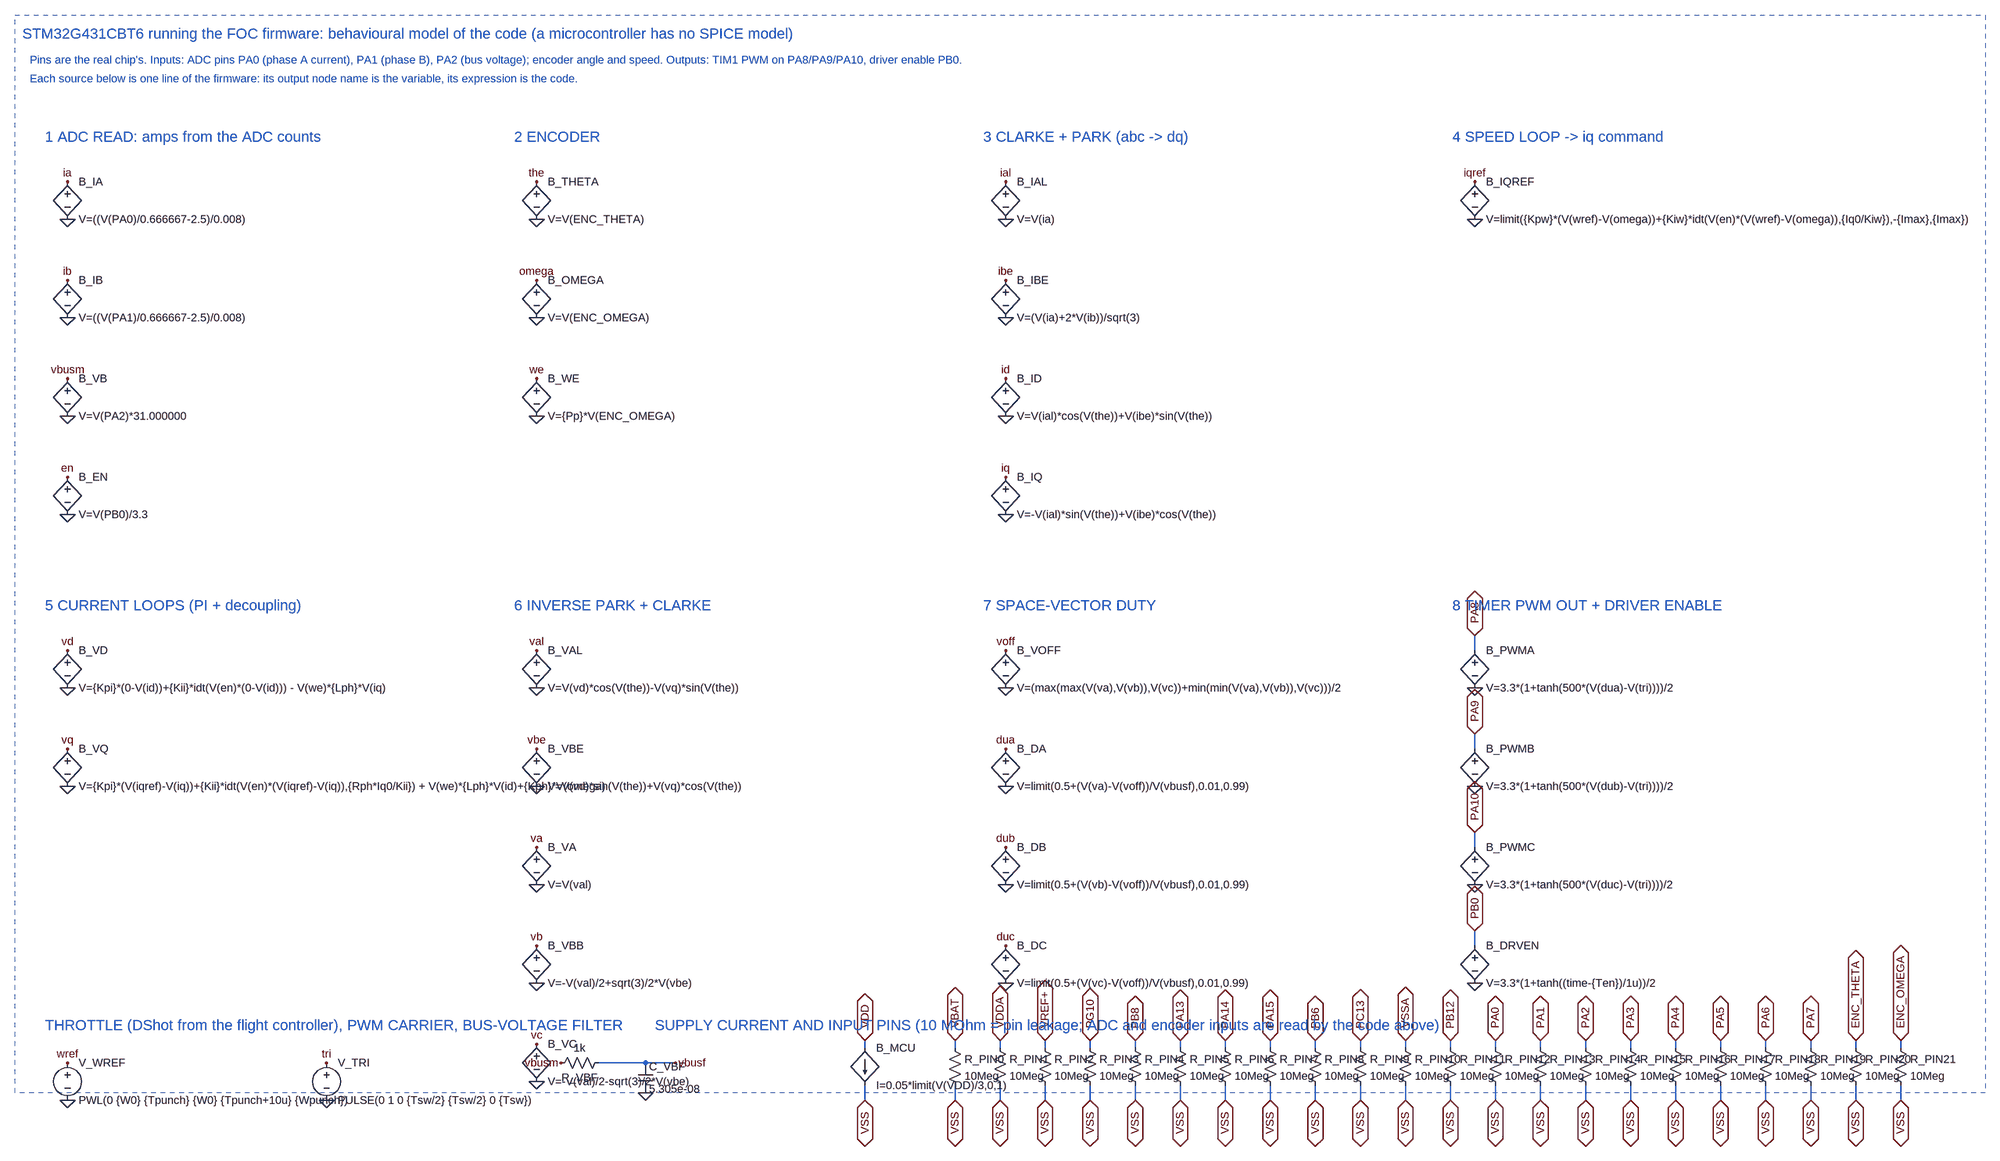
[diagram p0: schematic STM32G431_FOC.asc]
STM32G431_FOC.asc, the LTspice schematic file:
Version 4
SHEET 1 4804 3052
WIRE 1244 2236 1344 2236
WIRE 1344 2236 1408 2236
WIRE 1812 2188 1812 2204
WIRE 1812 2284 1812 2316
WIRE 2004 2188 2004 2204
WIRE 2004 2284 2004 2316
WIRE 2100 2188 2100 2204
WIRE 2100 2284 2100 2316
WIRE 2196 2188 2196 2204
WIRE 2196 2284 2196 2316
WIRE 2292 2188 2292 2204
WIRE 2292 2284 2292 2316
WIRE 2388 2188 2388 2204
WIRE 2388 2284 2388 2316
WIRE 2484 2188 2484 2204
WIRE 2484 2284 2484 2316
WIRE 2580 2188 2580 2204
WIRE 2580 2284 2580 2316
WIRE 2676 2188 2676 2204
WIRE 2676 2284 2676 2316
WIRE 2772 2188 2772 2204
WIRE 2772 2284 2772 2316
WIRE 2868 2188 2868 2204
WIRE 2868 2284 2868 2316
WIRE 2964 2188 2964 2204
WIRE 2964 2284 2964 2316
WIRE 3060 2188 3060 2204
WIRE 3060 2284 3060 2316
WIRE 3112 1324 3112 1356
WIRE 3112 1534 3112 1566
WIRE 3112 1744 3112 1776
WIRE 3112 1954 3112 1986
WIRE 3156 2188 3156 2204
WIRE 3156 2284 3156 2316
WIRE 3252 2188 3252 2204
WIRE 3252 2284 3252 2316
WIRE 3348 2188 3348 2204
WIRE 3348 2284 3348 2316
WIRE 3444 2188 3444 2204
WIRE 3444 2284 3444 2316
WIRE 3540 2188 3540 2204
WIRE 3540 2284 3540 2316
WIRE 3636 2188 3636 2204
WIRE 3636 2284 3636 2316
WIRE 3732 2188 3732 2204
WIRE 3732 2284 3732 2316
WIRE 3828 2188 3828 2204
WIRE 3828 2284 3828 2316
WIRE 3924 2188 3924 2204
WIRE 3924 2284 3924 2316
WIRE 4020 2188 4020 2204
WIRE 4020 2284 4020 2316
FLAG 112 356 ia
FLAG 112 436 0
FLAG 112 566 ib
FLAG 112 646 0
FLAG 112 776 vbusm
FLAG 112 856 0
FLAG 112 986 en
FLAG 112 1066 0
FLAG 1112 356 the
FLAG 1112 436 0
FLAG 1112 566 omega
FLAG 1112 646 0
FLAG 1112 776 we
FLAG 1112 856 0
FLAG 2112 356 ial
FLAG 2112 436 0
FLAG 2112 566 ibe
FLAG 2112 646 0
FLAG 2112 776 id
FLAG 2112 856 0
FLAG 2112 986 iq
FLAG 2112 1066 0
FLAG 3112 356 iqref
FLAG 3112 436 0
FLAG 112 1356 vd
FLAG 112 1436 0
FLAG 112 1566 vq
FLAG 112 1646 0
FLAG 1112 1356 val
FLAG 1112 1436 0
FLAG 1112 1566 vbe
FLAG 1112 1646 0
FLAG 1112 1776 va
FLAG 1112 1856 0
FLAG 1112 1986 vb
FLAG 1112 2066 0
FLAG 1112 2196 vc
FLAG 1112 2276 0
FLAG 2112 1356 voff
FLAG 2112 1436 0
FLAG 2112 1566 dua
FLAG 2112 1646 0
FLAG 2112 1776 dub
FLAG 2112 1856 0
FLAG 2112 1986 duc
FLAG 2112 2066 0
FLAG 3112 1324 PA8
FLAG 3112 1436 0
FLAG 3112 1534 PA9
FLAG 3112 1646 0
FLAG 3112 1744 PA10
FLAG 3112 1856 0
FLAG 3112 1954 PB0
FLAG 3112 2066 0
FLAG 112 2236 wref
FLAG 112 2316 0
FLAG 664 2236 tri
FLAG 664 2316 0
FLAG 1164 2236 vbusm
FLAG 1344 2300 0
FLAG 1408 2236 vbusf
FLAG 1812 2188 VDD
FLAG 1812 2316 VSS
FLAG 2004 2188 VBAT
FLAG 2004 2316 VSS
FLAG 2100 2188 VDDA
FLAG 2100 2316 VSS
FLAG 2196 2188 VREF+
FLAG 2196 2316 VSS
FLAG 2292 2188 PG10
FLAG 2292 2316 VSS
FLAG 2388 2188 PB8
FLAG 2388 2316 VSS
FLAG 2484 2188 PA13
FLAG 2484 2316 VSS
FLAG 2580 2188 PA14
FLAG 2580 2316 VSS
FLAG 2676 2188 PA15
FLAG 2676 2316 VSS
FLAG 2772 2188 PB6
FLAG 2772 2316 VSS
FLAG 2868 2188 PC13
FLAG 2868 2316 VSS
FLAG 2964 2188 VSSA
FLAG 2964 2316 VSS
FLAG 3060 2188 PB12
FLAG 3060 2316 VSS
FLAG 3156 2188 PA0
FLAG 3156 2316 VSS
FLAG 3252 2188 PA1
FLAG 3252 2316 VSS
FLAG 3348 2188 PA2
FLAG 3348 2316 VSS
FLAG 3444 2188 PA3
FLAG 3444 2316 VSS
FLAG 3540 2188 PA4
FLAG 3540 2316 VSS
FLAG 3636 2188 PA5
FLAG 3636 2316 VSS
FLAG 3732 2188 PA6
FLAG 3732 2316 VSS
FLAG 3828 2188 PA7
FLAG 3828 2316 VSS
FLAG 3924 2188 ENC_THETA
FLAG 3924 2316 VSS
FLAG 4020 2188 ENC_OMEGA
FLAG 4020 2316 VSS
IOPIN 3112 1324 BiDir
IOPIN 3112 1534 BiDir
IOPIN 3112 1744 BiDir
IOPIN 3112 1954 BiDir
IOPIN 1812 2188 BiDir
IOPIN 1812 2316 BiDir
IOPIN 2004 2188 BiDir
IOPIN 2004 2316 BiDir
IOPIN 2100 2188 BiDir
IOPIN 2100 2316 BiDir
IOPIN 2196 2188 BiDir
IOPIN 2196 2316 BiDir
IOPIN 2292 2188 BiDir
IOPIN 2292 2316 BiDir
IOPIN 2388 2188 BiDir
IOPIN 2388 2316 BiDir
IOPIN 2484 2188 BiDir
IOPIN 2484 2316 BiDir
IOPIN 2580 2188 BiDir
IOPIN 2580 2316 BiDir
IOPIN 2676 2188 BiDir
IOPIN 2676 2316 BiDir
IOPIN 2772 2188 BiDir
IOPIN 2772 2316 BiDir
IOPIN 2868 2188 BiDir
IOPIN 2868 2316 BiDir
IOPIN 2964 2188 BiDir
IOPIN 2964 2316 BiDir
IOPIN 3060 2188 BiDir
IOPIN 3060 2316 BiDir
IOPIN 3156 2188 BiDir
IOPIN 3156 2316 BiDir
IOPIN 3252 2188 BiDir
IOPIN 3252 2316 BiDir
IOPIN 3348 2188 BiDir
IOPIN 3348 2316 BiDir
IOPIN 3444 2188 BiDir
IOPIN 3444 2316 BiDir
IOPIN 3540 2188 BiDir
IOPIN 3540 2316 BiDir
IOPIN 3636 2188 BiDir
IOPIN 3636 2316 BiDir
IOPIN 3732 2188 BiDir
IOPIN 3732 2316 BiDir
IOPIN 3828 2188 BiDir
IOPIN 3828 2316 BiDir
IOPIN 3924 2188 BiDir
IOPIN 3924 2316 BiDir
IOPIN 4020 2188 BiDir
IOPIN 4020 2316 BiDir
SYMBOL bv 112 340 R0
SYMATTR InstName B_IA
SYMATTR Value V=((V(PA0)/0.666667-2.5)/0.008)
SYMBOL bv 112 550 R0
SYMATTR InstName B_IB
SYMATTR Value V=((V(PA1)/0.666667-2.5)/0.008)
SYMBOL bv 112 760 R0
SYMATTR InstName B_VB
SYMATTR Value V=V(PA2)*31.000000
SYMBOL bv 112 970 R0
SYMATTR InstName B_EN
SYMATTR Value V=V(PB0)/3.3
SYMBOL bv 1112 340 R0
SYMATTR InstName B_THETA
SYMATTR Value V=V(ENC_THETA)
SYMBOL bv 1112 550 R0
SYMATTR InstName B_OMEGA
SYMATTR Value V=V(ENC_OMEGA)
SYMBOL bv 1112 760 R0
SYMATTR InstName B_WE
SYMATTR Value V={Pp}*V(ENC_OMEGA)
SYMBOL bv 2112 340 R0
SYMATTR InstName B_IAL
SYMATTR Value V=V(ia)
SYMBOL bv 2112 550 R0
SYMATTR InstName B_IBE
SYMATTR Value V=(V(ia)+2*V(ib))/sqrt(3)
SYMBOL bv 2112 760 R0
SYMATTR InstName B_ID
SYMATTR Value V=V(ial)*cos(V(the))+V(ibe)*sin(V(the))
SYMBOL bv 2112 970 R0
SYMATTR InstName B_IQ
SYMATTR Value V=-V(ial)*sin(V(the))+V(ibe)*cos(V(the))
SYMBOL bv 3112 340 R0
SYMATTR InstName B_IQREF
SYMATTR Value V=limit({Kpw}*(V(wref)-V(omega))+{Kiw}*idt(V(en)*(V(wref)-V(omega)),{Iq0/Kiw}),-{Imax},{Imax})
SYMBOL bv 112 1340 R0
SYMATTR InstName B_VD
SYMATTR Value V={Kpi}*(0-V(id))+{Kii}*idt(V(en)*(0-V(id))) - V(we)*{Lph}*V(iq)
SYMBOL bv 112 1550 R0
SYMATTR InstName B_VQ
SYMATTR Value V={Kpi}*(V(iqref)-V(iq))+{Kii}*idt(V(en)*(V(iqref)-V(iq)),{Rph*Iq0/Kii}) + V(we)*{Lph}*V(id)+{Kph}*V(omega)
SYMBOL bv 1112 1340 R0
SYMATTR InstName B_VAL
SYMATTR Value V=V(vd)*cos(V(the))-V(vq)*sin(V(the))
SYMBOL bv 1112 1550 R0
SYMATTR InstName B_VBE
SYMATTR Value V=V(vd)*sin(V(the))+V(vq)*cos(V(the))
SYMBOL bv 1112 1760 R0
SYMATTR InstName B_VA
SYMATTR Value V=V(val)
SYMBOL bv 1112 1970 R0
SYMATTR InstName B_VBB
SYMATTR Value V=-V(val)/2+sqrt(3)/2*V(vbe)
SYMBOL bv 1112 2180 R0
SYMATTR InstName B_VC
SYMATTR Value V=-V(val)/2-sqrt(3)/2*V(vbe)
SYMBOL bv 2112 1340 R0
SYMATTR InstName B_VOFF
SYMATTR Value V=(max(max(V(va),V(vb)),V(vc))+min(min(V(va),V(vb)),V(vc)))/2
SYMBOL bv 2112 1550 R0
SYMATTR InstName B_DA
SYMATTR Value V=limit(0.5+(V(va)-V(voff))/V(vbusf),0.01,0.99)
SYMBOL bv 2112 1760 R0
SYMATTR InstName B_DB
SYMATTR Value V=limit(0.5+(V(vb)-V(voff))/V(vbusf),0.01,0.99)
SYMBOL bv 2112 1970 R0
SYMATTR InstName B_DC
SYMATTR Value V=limit(0.5+(V(vc)-V(voff))/V(vbusf),0.01,0.99)
SYMBOL bv 3112 1340 R0
SYMATTR InstName B_PWMA
SYMATTR Value V=3.3*(1+tanh(500*(V(dua)-V(tri))))/2
SYMBOL bv 3112 1550 R0
SYMATTR InstName B_PWMB
SYMATTR Value V=3.3*(1+tanh(500*(V(dub)-V(tri))))/2
SYMBOL bv 3112 1760 R0
SYMATTR InstName B_PWMC
SYMATTR Value V=3.3*(1+tanh(500*(V(duc)-V(tri))))/2
SYMBOL bv 3112 1970 R0
SYMATTR InstName B_DRVEN
SYMATTR Value V=3.3*(1+tanh((time-{Ten})/1u))/2
SYMBOL voltage 112 2220 R0
SYMATTR InstName V_WREF
SYMATTR Value PWL(0 {W0} {Tpunch} {W0} {Tpunch+10u} {Wpunch})
SYMBOL voltage 664 2220 R0
SYMATTR InstName V_TRI
SYMATTR Value PULSE(0 1 0 {Tsw/2} {Tsw/2} 0 {Tsw})
SYMBOL res 1148 2252 R270
WINDOW 0 0 56 VBottom 2
WINDOW 3 32 56 VTop 2
SYMATTR InstName R_VBF
SYMATTR Value 1k
SYMBOL cap 1328 2236 R0
SYMATTR InstName C_VBF
SYMATTR Value 5.305e-08
SYMBOL bi 1812 2204 R0
SYMATTR InstName B_MCU
SYMATTR Value I=0.05*limit(V(VDD)/3,0,1)
SYMBOL res 1988 2188 R0
SYMATTR InstName R_PIN0
SYMATTR Value 10Meg
SYMBOL res 2084 2188 R0
SYMATTR InstName R_PIN1
SYMATTR Value 10Meg
SYMBOL res 2180 2188 R0
SYMATTR InstName R_PIN2
SYMATTR Value 10Meg
SYMBOL res 2276 2188 R0
SYMATTR InstName R_PIN3
SYMATTR Value 10Meg
SYMBOL res 2372 2188 R0
SYMATTR InstName R_PIN4
SYMATTR Value 10Meg
SYMBOL res 2468 2188 R0
SYMATTR InstName R_PIN5
SYMATTR Value 10Meg
SYMBOL res 2564 2188 R0
SYMATTR InstName R_PIN6
SYMATTR Value 10Meg
SYMBOL res 2660 2188 R0
SYMATTR InstName R_PIN7
SYMATTR Value 10Meg
SYMBOL res 2756 2188 R0
SYMATTR InstName R_PIN8
SYMATTR Value 10Meg
SYMBOL res 2852 2188 R0
SYMATTR InstName R_PIN9
SYMATTR Value 10Meg
SYMBOL res 2948 2188 R0
SYMATTR InstName R_PIN10
SYMATTR Value 10Meg
SYMBOL res 3044 2188 R0
SYMATTR InstName R_PIN11
SYMATTR Value 10Meg
SYMBOL res 3140 2188 R0
SYMATTR InstName R_PIN12
SYMATTR Value 10Meg
SYMBOL res 3236 2188 R0
SYMATTR InstName R_PIN13
SYMATTR Value 10Meg
SYMBOL res 3332 2188 R0
SYMATTR InstName R_PIN14
SYMATTR Value 10Meg
SYMBOL res 3428 2188 R0
SYMATTR InstName R_PIN15
SYMATTR Value 10Meg
SYMBOL res 3524 2188 R0
SYMATTR InstName R_PIN16
SYMATTR Value 10Meg
SYMBOL res 3620 2188 R0
SYMATTR InstName R_PIN17
SYMATTR Value 10Meg
SYMBOL res 3716 2188 R0
SYMATTR InstName R_PIN18
SYMATTR Value 10Meg
SYMBOL res 3812 2188 R0
SYMATTR InstName R_PIN19
SYMATTR Value 10Meg
SYMBOL res 3908 2188 R0
SYMATTR InstName R_PIN20
SYMATTR Value 10Meg
SYMBOL res 4004 2188 R0
SYMATTR InstName R_PIN21
SYMATTR Value 10Meg
RECTANGLE Normal 4200 2300 0 0 2
TEXT 16 40 Left 3 ;STM32G431CBT6 running the FOC firmware: behavioural model of the code (a microcontroller has no SPICE model)
TEXT 32 96 Left 2 ;Pins are the real chip's. Inputs: ADC pins PA0 (phase A current), PA1 (phase B), PA2 (bus voltage); encoder angle and speed. Outputs: TIM1 PWM on PA8/PA9/PA10, driver enable PB0.
TEXT 32 136 Left 2 ;Each source below is one line of the firmware: its output node name is the variable, its expression is the code.
TEXT 64 260 Left 3 ;1 ADC READ: amps from the ADC counts
TEXT 1064 260 Left 3 ;2 ENCODER
TEXT 2064 260 Left 3 ;3 CLARKE + PARK (abc -> dq)
TEXT 3064 260 Left 3 ;4 SPEED LOOP -> iq command
TEXT 64 1260 Left 3 ;5 CURRENT LOOPS (PI + decoupling)
TEXT 1064 1260 Left 3 ;6 INVERSE PARK + CLARKE
TEXT 2064 1260 Left 3 ;7 SPACE-VECTOR DUTY
TEXT 3064 1260 Left 3 ;8 TIMER PWM OUT + DRIVER ENABLE
TEXT 64 2156 Left 3 ;THROTTLE (DShot from the flight controller), PWM CARRIER, BUS-VOLTAGE FILTER
TEXT 1364 2156 Left 3 ;SUPPLY CURRENT AND INPUT PINS (10 MOhm = pin leakage; ADC and encoder inputs are read by the code above)

The netlist it stands for:
* STM32G431_FOC.asc
B_IA ia 0 V=((V(PA0)/0.666667-2.5)/0.008)
B_IB ib 0 V=((V(PA1)/0.666667-2.5)/0.008)
B_VB vbusm 0 V=V(PA2)*31.000000
B_EN en 0 V=V(PB0)/3.3
B_THETA the 0 V=V(ENC_THETA)
B_OMEGA omega 0 V=V(ENC_OMEGA)
B_WE we 0 V={Pp}*V(ENC_OMEGA)
B_IAL ial 0 V=V(ia)
B_IBE ibe 0 V=(V(ia)+2*V(ib))/sqrt(3)
B_ID id 0 V=V(ial)*cos(V(the))+V(ibe)*sin(V(the))
B_IQ iq 0 V=-V(ial)*sin(V(the))+V(ibe)*cos(V(the))
B_IQREF iqref 0 V=limit({Kpw}*(V(wref)-V(omega))+{Kiw}*idt(V(en)*(V(wref)-V(omega)),{Iq0/Kiw}),-{Imax},{Imax})
B_VD vd 0 V={Kpi}*(0-V(id))+{Kii}*idt(V(en)*(0-V(id))) - V(we)*{Lph}*V(iq)
B_VQ vq 0 V={Kpi}*(V(iqref)-V(iq))+{Kii}*idt(V(en)*(V(iqref)-V(iq)),{Rph*Iq0/Kii}) + V(we)*{Lph}*V(id)+{Kph}*V(omega)
B_VAL val 0 V=V(vd)*cos(V(the))-V(vq)*sin(V(the))
B_VBE vbe 0 V=V(vd)*sin(V(the))+V(vq)*cos(V(the))
B_VA va 0 V=V(val)
B_VBB vb 0 V=-V(val)/2+sqrt(3)/2*V(vbe)
B_VC vc 0 V=-V(val)/2-sqrt(3)/2*V(vbe)
B_VOFF voff 0 V=(max(max(V(va),V(vb)),V(vc))+min(min(V(va),V(vb)),V(vc)))/2
B_DA dua 0 V=limit(0.5+(V(va)-V(voff))/V(vbusf),0.01,0.99)
B_DB dub 0 V=limit(0.5+(V(vb)-V(voff))/V(vbusf),0.01,0.99)
B_DC duc 0 V=limit(0.5+(V(vc)-V(voff))/V(vbusf),0.01,0.99)
B_PWMA PA8 0 V=3.3*(1+tanh(500*(V(dua)-V(tri))))/2
B_PWMB PA9 0 V=3.3*(1+tanh(500*(V(dub)-V(tri))))/2
B_PWMC PA10 0 V=3.3*(1+tanh(500*(V(duc)-V(tri))))/2
B_DRVEN PB0 0 V=3.3*(1+tanh((time-{Ten})/1u))/2
V_WREF wref 0 PWL(0 {W0} {Tpunch} {W0} {Tpunch+10u} {Wpunch})
V_TRI tri 0 PULSE(0 1 0 {Tsw/2} {Tsw/2} 0 {Tsw})
R_VBF vbusm vbusf 1k
C_VBF vbusf 0 5.305e-08
B_MCU VDD VSS I=0.05*limit(V(VDD)/3,0,1)
R_PIN0 VBAT VSS 10Meg
R_PIN1 VDDA VSS 10Meg
R_PIN2 VREF+ VSS 10Meg
R_PIN3 PG10 VSS 10Meg
R_PIN4 PB8 VSS 10Meg
R_PIN5 PA13 VSS 10Meg
R_PIN6 PA14 VSS 10Meg
R_PIN7 PA15 VSS 10Meg
R_PIN8 PB6 VSS 10Meg
R_PIN9 PC13 VSS 10Meg
R_PIN10 VSSA VSS 10Meg
R_PIN11 PB12 VSS 10Meg
R_PIN12 PA0 VSS 10Meg
R_PIN13 PA1 VSS 10Meg
R_PIN14 PA2 VSS 10Meg
R_PIN15 PA3 VSS 10Meg
R_PIN16 PA4 VSS 10Meg
R_PIN17 PA5 VSS 10Meg
R_PIN18 PA6 VSS 10Meg
R_PIN19 PA7 VSS 10Meg
R_PIN20 ENC_THETA VSS 10Meg
R_PIN21 ENC_OMEGA VSS 10Meg
* STM32G431CBT6 running the FOC firmware: behavioural model of the code (a microcontroller has no SPICE model)
* Pins are the real chip's. Inputs: ADC pins PA0 (phase A current), PA1 (phase B), PA2 (bus voltage); encoder angle and speed. Outputs: TIM1 PWM on PA8/PA9/PA10, driver enable PB0.
* Each source below is one line of the firmware: its output node name is the variable, its expression is the code.
* 1 ADC READ: amps from the ADC counts
* 2 ENCODER
* 3 CLARKE + PARK (abc -> dq)
* 4 SPEED LOOP -> iq command
* 5 CURRENT LOOPS (PI + decoupling)
* 6 INVERSE PARK + CLARKE
* 7 SPACE-VECTOR DUTY
* 8 TIMER PWM OUT + DRIVER ENABLE
* THROTTLE (DShot from the flight controller), PWM CARRIER, BUS-VOLTAGE FILTER
* SUPPLY CURRENT AND INPUT PINS (10 MOhm = pin leakage; ADC and encoder inputs are read by the code above)
.backanno
.end